# Altium schematic sheet 30_AFE_COMM.SchDoc
size A3; SheetNumber: 4; SheetTotal: 4
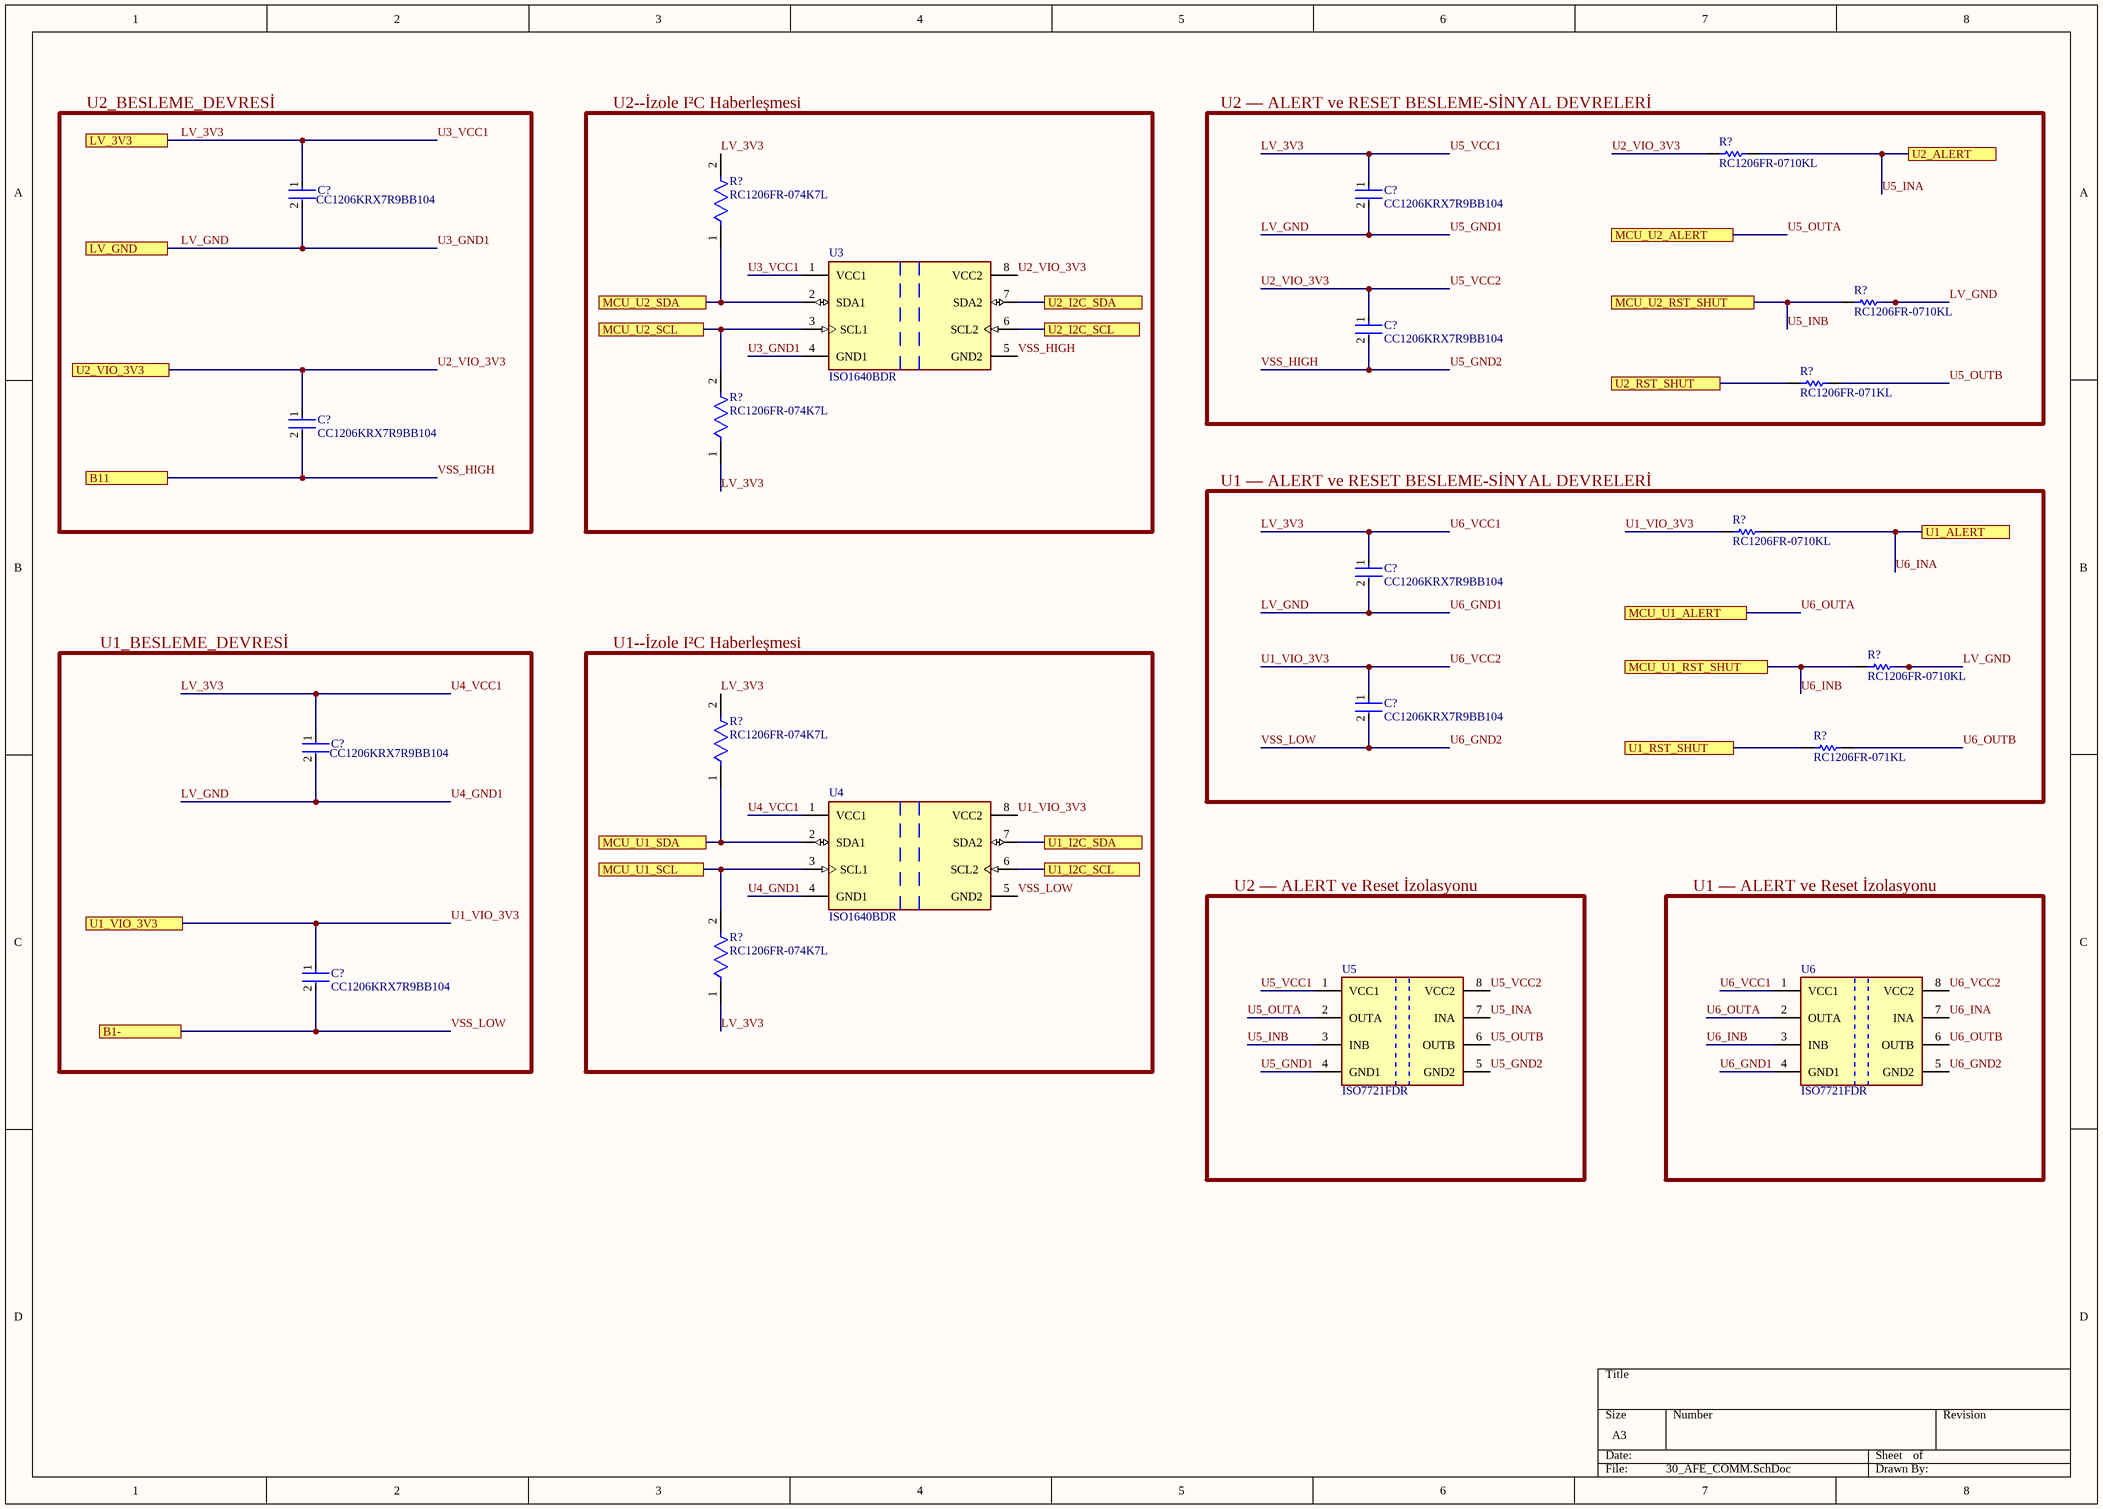
[diagram p0: 30_AFE_COMM.SchDoc]

## Parts
(Parts that share a designator on the sheet are numbered #1, #2 ... from top to bottom, then left to right.)
C?#1  CC1206KRX7R9BB104  [FP-CC1206-1_25-MFG]
C?#2  CC1206KRX7R9BB104  [FP-CC1206-1_25-MFG]
C?#3  CC1206KRX7R9BB104  [FP-CC1206-1_25-MFG]
C?#4  CC1206KRX7R9BB104  [FP-CC1206-1_25-MFG]
C?#5  CC1206KRX7R9BB104  [FP-CC1206-1_25-MFG]
C?#6  CC1206KRX7R9BB104  [FP-CC1206-1_25-MFG]
C?#7  CC1206KRX7R9BB104  [FP-CC1206-1_25-MFG]
C?#8  CC1206KRX7R9BB104  [FP-CC1206-1_25-MFG]
R?#1  RC1206FR-0710KL  [RESC3116X65X40ML10T20]
R?#2  RC1206FR-074K7L  [FP-RC1206-0_65-IPC_B]
R?#3  RC1206FR-0710KL  [RESC3116X65X40ML10T20]
R?#4  RC1206FR-071KL  [RESC3116X65X40ML10T20]
R?#5  RC1206FR-074K7L  [FP-RC1206-0_65-IPC_B]
R?#6  RC1206FR-0710KL  [RESC3116X65X40ML10T20]
R?#7  RC1206FR-0710KL  [RESC3116X65X40ML10T20]
R?#8  RC1206FR-071KL  [RESC3116X65X40ML10T20]
R?#9  RC1206FR-074K7L  [FP-RC1206-0_65-IPC_B]
R?#10  RC1206FR-074K7L  [FP-RC1206-0_65-IPC_B]
U3  ISO1640BDR  [FP-D0008A-IPC_C]
U4  ISO1640BDR  [FP-D0008A-IPC_C]
U5  ISO7721FDR  [FP-D0008A-IPC_B]
U6  ISO7721FDR  [FP-D0008A-IPC_B]

## Ports
B1-, B11, LV_3V3, LV_GND, MCU_U1_ALERT, MCU_U1_RST_SHUT, MCU_U1_SCL, MCU_U1_SDA, MCU_U2_ALERT, MCU_U2_RST_SHUT, MCU_U2_SCL, MCU_U2_SDA, U1_ALERT, U1_I2C_SCL, U1_I2C_SDA, U1_RST_SHUT, U1_VIO_3V3, U2_ALERT, U2_I2C_SCL, U2_I2C_SDA, U2_RST_SHUT, U2_VIO_3V3

## Nets
LV_3V3: C?#1.1 C?#2.1 C?#5.1 C?#7.1 R?#2.2 R?#5.1 R?#9.2 R?#10.1 U3.1(VCC1) U4.1(VCC1) U5.1(VCC1) U6.1(VCC1) ; port LV_3V3  [also labelled U3_VCC1, U4_VCC1, U5_VCC1, U6_VCC1]
LV_GND: C?#1.2 C?#2.2 C?#5.2 C?#7.2 R?#3.2 R?#7.2 U3.4(GND1) U4.4(GND1) U5.4(GND1) U6.4(GND1) ; port LV_GND  [also labelled U3_GND1, U4_GND1, U5_GND1, U6_GND1]
MCU_U1_SCL: R?#10.2 U4.3(SCL1) ; port MCU_U1_SCL
MCU_U1_SDA: R?#9.1 U4.2(SDA1) ; port MCU_U1_SDA
MCU_U2_SCL: R?#5.2 U3.3(SCL1) ; port MCU_U2_SCL
MCU_U2_SDA: R?#2.1 U3.2(SDA1) ; port MCU_U2_SDA
U1_I2C_SCL: U4.6(SCL2) ; port U1_I2C_SCL
U1_I2C_SDA: U4.7(SDA2) ; port U1_I2C_SDA
U1_RST_SHUT: R?#8.1 ; port U1_RST_SHUT
U1_VIO_3V3: C?#6.1 C?#8.1 R?#6.2 U4.8(VCC2) U6.8(VCC2) ; port U1_VIO_3V3  [also labelled U6_VCC2]
U2_I2C_SCL: U3.6(SCL2) ; port U2_I2C_SCL
U2_I2C_SDA: U3.7(SDA2) ; port U2_I2C_SDA
U2_RST_SHUT: R?#4.1 ; port U2_RST_SHUT
U2_VIO_3V3: C?#3.1 C?#4.1 R?#1.2 U3.8(VCC2) U5.8(VCC2) ; port U2_VIO_3V3  [also labelled U5_VCC2]
U5_GND2: C?#3.2 C?#4.2 U3.5(GND2) U5.5(GND2) ; port B11  [also labelled VSS_HIGH]
U5_INA: R?#1.1 U5.7(INA) ; port U2_ALERT
U5_INB: R?#3.1 U5.3(INB) ; port MCU_U2_RST_SHUT
U5_OUTA: U5.2(OUTA) ; port MCU_U2_ALERT
U5_OUTB: R?#4.2 U5.6(OUTB)
U6_GND2: C?#6.2 C?#8.2 U4.5(GND2) U6.5(GND2) ; port B1-  [also labelled VSS_LOW]
U6_INA: R?#6.1 U6.7(INA) ; port U1_ALERT
U6_INB: R?#7.1 U6.3(INB) ; port MCU_U1_RST_SHUT
U6_OUTA: U6.2(OUTA) ; port MCU_U1_ALERT
U6_OUTB: R?#8.2 U6.6(OUTB)

## Notes on the sheet
- Labels drawn without touching a wire or pin: U1 — ALERT ve RESET BESLEME-SİNYAL DEVRELERİ, U1 — ALERT ve Reset İzolasyonu, U1--İzole I²C Haberleşmesi, U1_BESLEME_DEVRESİ, U2 — ALERT ve RESET BESLEME-SİNYAL DEVRELERİ, U2 — ALERT ve Reset İzolasyonu, U2--İzole I²C Haberleşmesi, U2_BESLEME_DEVRESİ

## Library data of the parts
C?#1-C?#8 = CMP-03422-000842-1: CAP CER 0.1UF 50V X7R 1206; Manufacturer: Yageo; Automotive Grade: NA; Value: 100 nF; Tolerance: 0.1; Material: Ceramic; Temperature Coefficient: 15%; Temperature Characteristic: X7R; Device Class L1: Passive Components; Lead Free: Yes; Octopart: https://octopart.com/cc1206krx7r9bb104-yageo-39467816; Category: Cap; Temperature Range Low: -55°C; Device Class L3: Ceramic Capacitors; Voltage Rating: 50 V; Temperature Range High: +125°C; Device Class L2: Capacitors; RoHS: TRUE; Package: CC1206-1.25; Footprint Url: http://www.yageo.com/exep/pages/download/literatures/UPY-C_GEN_24.pdf; ComponentLink2Description: Datasheet; Temperature: -55°C to +125°C; Capacitance: 100 nF; Digikey Description: CAP CER 0.1UF 50V X7R 1206; Height: 1.45mm; Automotive: No; Mouser Description: Multilayer Ceramic Capacitors MLCC - SMD/SMT 100nF 50V X7R 10%; ComponentLink2URL: http://www.yageo.com/documents/recent/UPY-NP0X7R_HV_1KV-to-3KV_11.pdf; Manufacturer Part Number: CC1206KRX7R9BB104
R?#1 R?#3 R?#6 R?#7 = CMP-1014-00623-2: Chip Resistor, 10 KOhm, +/- 1%, 0.25 W, -55 to 155 degC, 1206 (3216 Metric), RoHS, Tape and Reel; Manufacturer: Yageo; Voltage Rating: 200V; Resistance: 10KOhm; Temperature Coefficient: 100ppm/degreesC; Power Rating: 250mW; Packaging: TapeandReel; Termination: SMD/SMT; REACH SVHC: Unknown; Tolerance: 1%; Height: 0.55mm; Composition: ThickFilm; Max Operating Temperature: 155degC; Datasheet Version: Rev. 5, 10/2016; Lead Free: LeadFree; Case Code (Metric): 3216; Depth: 1.6mm; Package Quantity: 5000; RoHSCompliant: true; Military Standard: Not; Case/Package: 1206; Case Code (Imperial): 1206; Min Operating Temperature: -55degC; Datasheet URL: http://www.yageo.com/NewPortal/yageodocoutput?fileName=/pdf/R-Chip/PYu-RC_Group_51_RoHS_L_5.pdf; Length: 3.1mm; Manufacturer URL: http://www.yageo.com/; Package Reference: 1206.0; Width: 1.6mm; Package Description: 2-Pin Surface Mount Device, Body 3.1 x 1.6 mm
R?#2 R?#5 R?#9 R?#10 = CMP-03412-037805-1: RES SMD 4.7K OHM 1% 1/4W 1206; Max Power Dissipation: 250mW; Voltage Rating: 200V; Temperature Coefficient: 100ppm/°C; Resistance: 4.7kR; Construction: Rectangular; RoHS Compliant: Yes; Max Operating Temperature: 155°C; Tolerance: 1%; Height: 0.026inch; Features: Moisture Resistant; Military Standard: Not; Series: RC; Termination: SMD/SMT; Number of Terminations: 2; Number of Pins: 2; Case Code (Imperial): 1206; Case/Package: 1206; Case Code (Metric): 3216; Voltage Rating (DC): 200V; Width: 0.063inch; Min Operating Temperature: -55°C; Resistance Tolerance: 1%; Length: 0.122inch; Size Code: 1206; Lead Free: Lead Free; Depth: 1.6mm; Packaging: Tape and Reel; Package Quantity: 1; Power Rating: 250mW; Resistor Type: Thick Film
R?#4 R?#8 = CMP-2100-03678-1: Chip Resistor, 1 KOhm, +/- 1%, 0.25 W, -55 to 155 degC, 1206 (3216 Metric), RoHS, Tape and Reel; Manufacturer: Yageo; Temperature Coefficient: 100ppm/degreesC; Power Rating: 250mW; Voltage Rating: 200V; Resistance: 1KOhm; Composition: ThickFilm; Min Operating Temperature: -55degC; Tolerance: 1%; REACH SVHC: Unknown; Case Code (Metric): 3216; Military Standard: Not; Datasheet Version: Rev. 5, 10/2016; Package Reference: 1206.0; Case/Package: 1206; Length: 3.1mm; Manufacturer URL: http://www.yageo.com/; Lead Free: LeadFree; RoHSCompliant: true; Termination: SMD/SMT; Packaging: TapeandReel; Package Description: 2-Pin Surface Mount Device, Body 3.1 x 1.6 mm; Depth: 1.6mm; Case Code (Imperial): 1206; Max Operating Temperature: 155degC; Datasheet URL: http://www.yageo.com/NewPortal/yageodocoutput?fileName=/pdf/R-Chip/PYu-RC_Group_51_RoHS_L_5.pdf; Height: 0.55mm
U3 U4 = CMP-04872-000071-1: ROBUST-EMC BIDIRECTIONAL I2C DIG; RoHS Compliant: Yes
U5 U6 = CMP-04872-000124-1: DGTL ISO 3000VRMS 2CH GP 8SOIC; Number of Channels: 2; Isolated Power: No; Propagation Delay: 16ns; Channel Type: Unidirectional; Data Rate: 100Mbps; Pulse Width Distortion (PWD): 4.9ns; Packaging: Tape and Reel; Mount: Surface Mount; Case/Package: SOIC; RoHS Compliant: Yes; Min Operating Temperature: -55°C; Max Operating Temperature: 125°C; Type: General Purpose; Number of Pins: 8